# EAGLE design mem3-c (EAGLE 4.13)
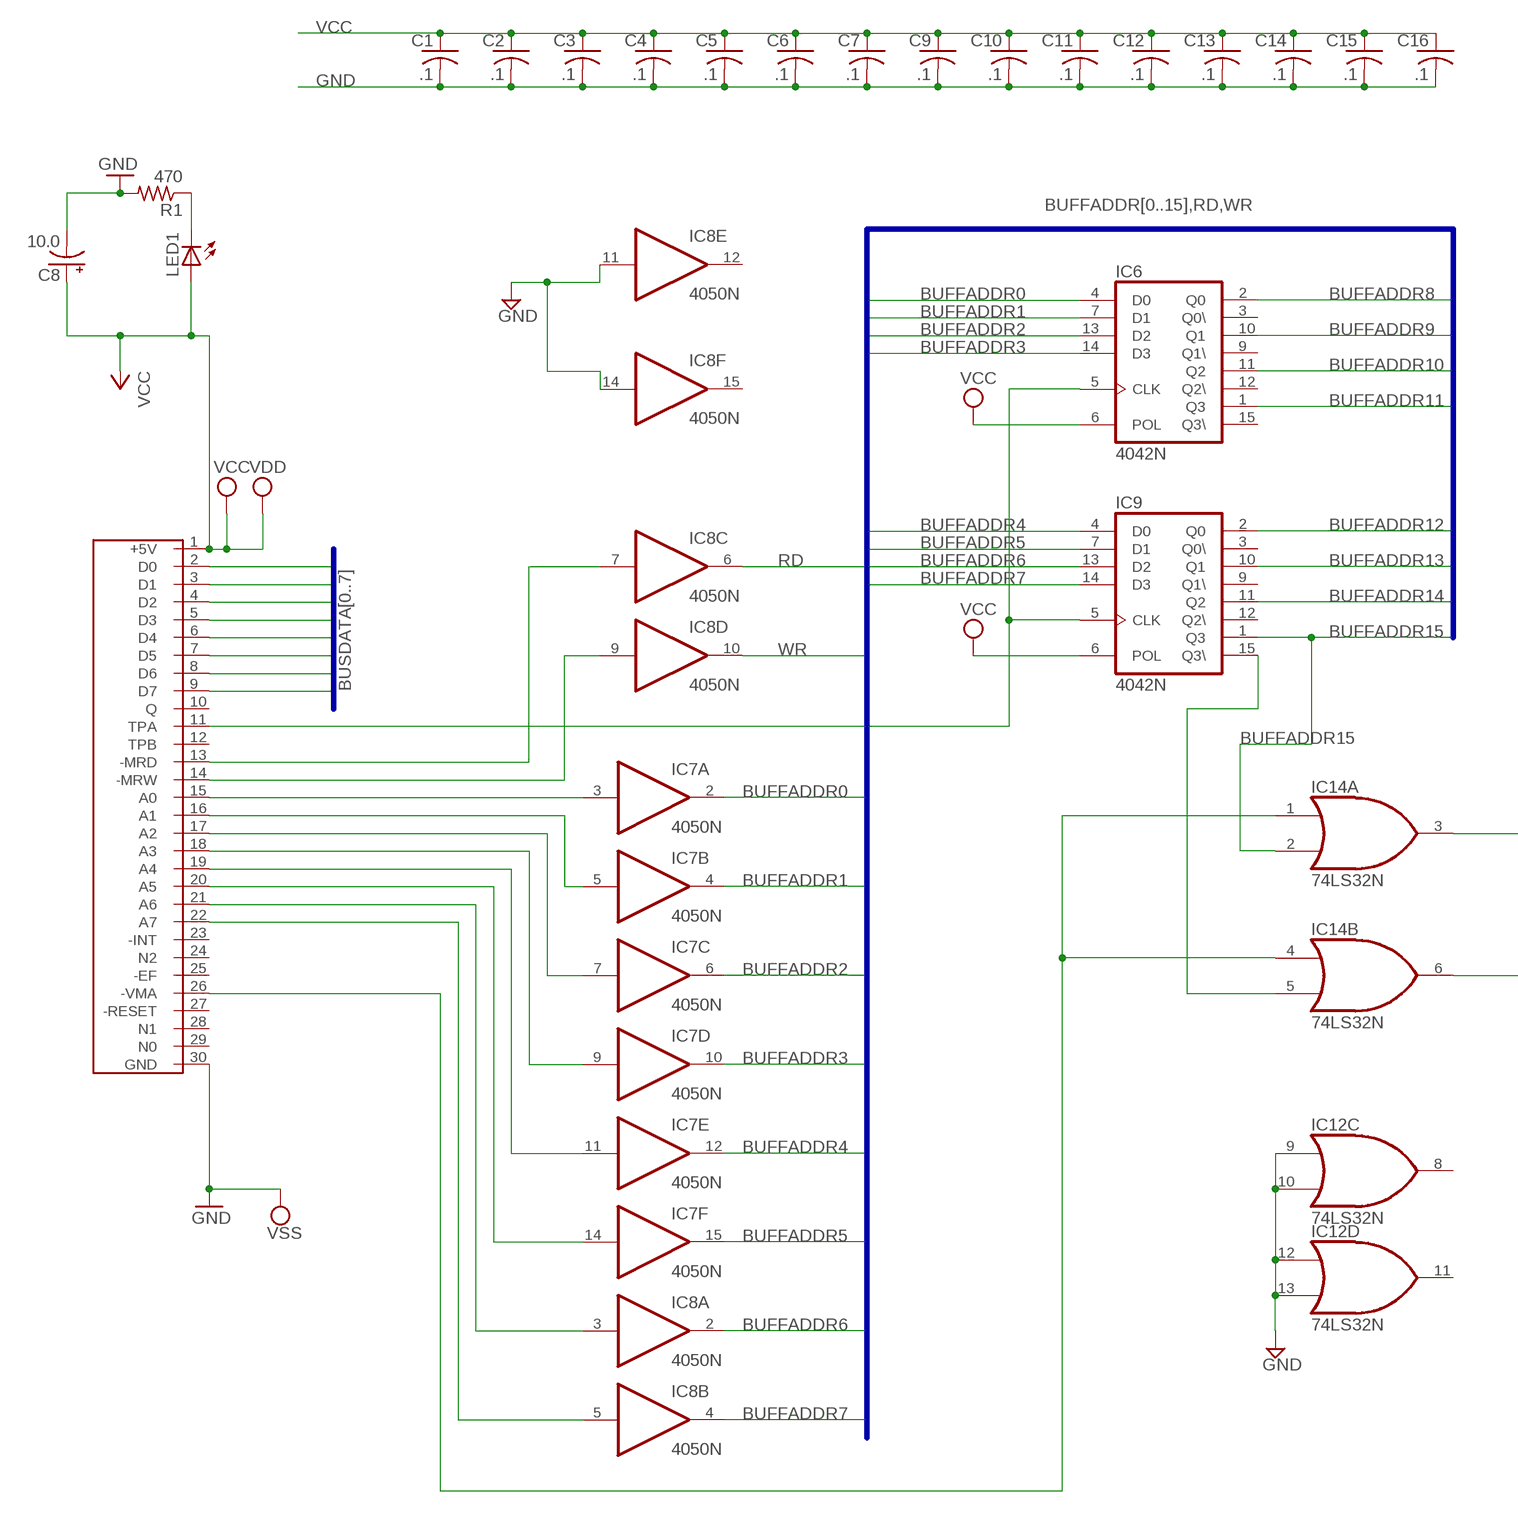
[diagram p0: schematic, sheet 1, part 1 of 2]
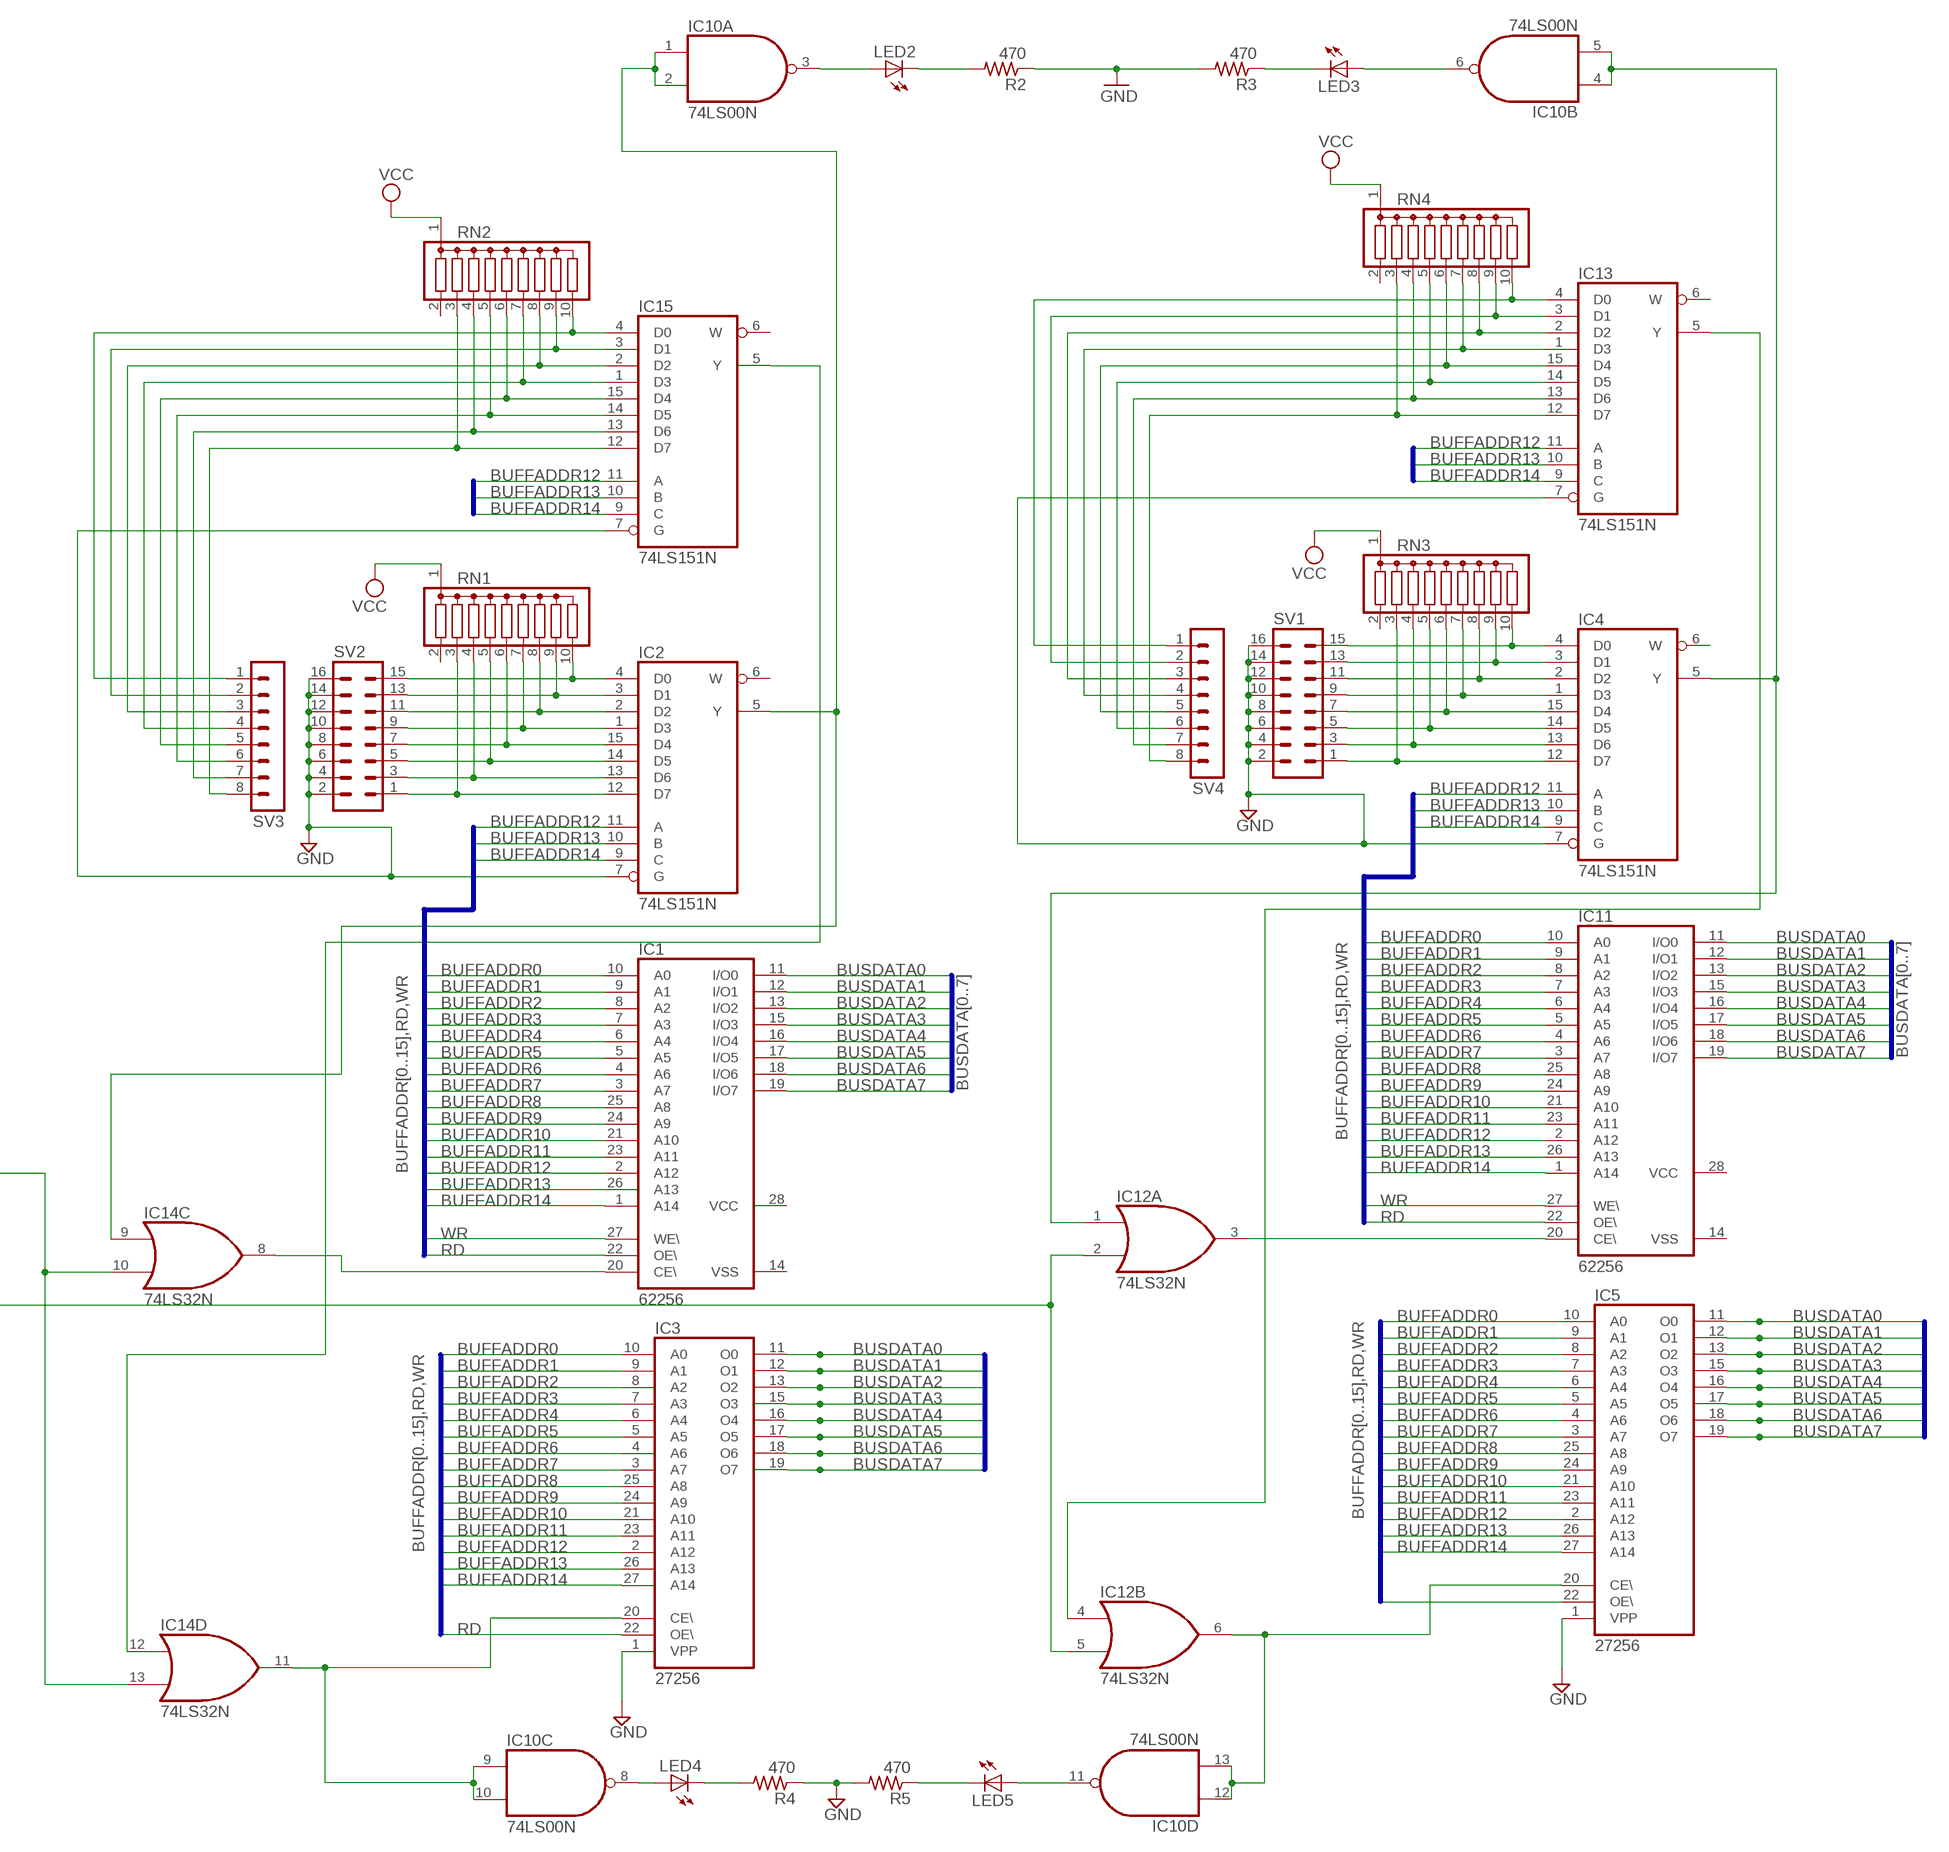
[diagram p1: schematic, sheet 1, part 2 of 2]

## Parts
C1  .1  C-US025-050X050  [C025-050X050]
C2  .1  C-US025-050X050  [C025-050X050]
C3  .1  C-US025-050X050  [C025-050X050]
C4  .1  C-US025-050X050  [C025-050X050]
C5  .1  C-US025-050X050  [C025-050X050]
C6  .1  C-US025-050X050  [C025-050X050]
C7  .1  C-US025-050X050  [C025-050X050]
C8  10.0  CPOL-USE2.5-7  [E2,5-7]
C9  .1  C-US025-050X050  [C025-050X050]
C10  .1  C-US025-050X050  [C025-050X050]
C11  .1  C-US025-050X050  [C025-050X050]
C12  .1  C-US025-050X050  [C025-050X050]
C13  .1  C-US025-050X050  [C025-050X050]
C14  .1  C-US025-050X050  [C025-050X050]
C15  .1  C-US025-050X050  [C025-050X050]
C16  .1  C-US025-050X050  [C025-050X050]
IC1  62256  58C256P  [DIL28-6]
IC2  74LS151N  [DIL16]
IC3  27256  [DIL28]
IC4  74LS151N  [DIL16]
IC5  27256  [DIL28]
IC6  4042N  [DIL16]
IC7  4050N  [DIL16]
IC8  4050N  [DIL16]
IC9  4042N  [DIL16]
IC10  74LS00N  [DIL14]
IC11  62256  58C256P  [DIL28-6]
IC12  74LS32N  [DIL14]
IC13  74LS151N  [DIL16]
IC14  74LS32N  [DIL14]
IC15  74LS151N  [DIL16]
LED1  LED5MM  [LED5MM]
LED2  LED5MM  [LED5MM]
LED3  LED5MM  [LED5MM]
LED4  LED5MM  [LED5MM]
LED5  LED5MM  [LED5MM]
R1  470  R-US_0207/7  [0207/7]
R2  470  R-US_0207/7  [0207/7]
R3  470  R-US_0207/7  [0207/7]
R4  470  R-US_0207/7  [0207/7]
R5  470  R-US_0207/7  [0207/7]
RN1  G09R  [SIL10]
RN2  G09R  [SIL10]
RN3  G09R  [SIL10]
RN4  G09R  [SIL10]
SV1  MA08-2  [MA08-2]
SV2  MA08-2  [MA08-2]
SV3  MA08-1  [MA08-1]
SV4  MA08-1  [MA08-1]
U$1  C30  [C30]

## Nets
BUFFADDR0: IC1.10(A0) IC3.10(A0) IC5.10(A0) IC6.4(D0) IC7.2(A:O) IC11.10(A0)
BUFFADDR1: IC1.9(A1) IC3.9(A1) IC5.9(A1) IC6.7(D1) IC7.4(B:O) IC11.9(A1)
BUFFADDR2: IC1.8(A2) IC3.8(A2) IC5.8(A2) IC6.13(D2) IC7.6(C:O) IC11.8(A2)
BUFFADDR3: IC1.7(A3) IC3.7(A3) IC5.7(A3) IC6.14(D3) IC7.10(D:O) IC11.7(A3)
BUFFADDR4: IC1.6(A4) IC3.6(A4) IC5.6(A4) IC7.12(E:O) IC9.4(D0) IC11.6(A4)
BUFFADDR5: IC1.5(A5) IC3.5(A5) IC5.5(A5) IC7.15(F:O) IC9.7(D1) IC11.5(A5)
BUFFADDR6: IC1.4(A6) IC3.4(A6) IC5.4(A6) IC8.2(A:O) IC9.13(D2) IC11.4(A6)
BUFFADDR7: IC1.3(A7) IC3.3(A7) IC5.3(A7) IC8.4(B:O) IC9.14(D3) IC11.3(A7)
BUFFADDR8: IC1.25(A8) IC3.25(A8) IC5.25(A8) IC6.2(Q0) IC11.25(A8)
BUFFADDR9: IC1.24(A9) IC3.24(A9) IC5.24(A9) IC6.10(Q1) IC11.24(A9)
BUFFADDR10: IC1.21(A10) IC3.21(A10) IC5.21(A10) IC6.11(Q2) IC11.21(A10)
BUFFADDR11: IC1.23(A11) IC3.23(A11) IC5.23(A11) IC6.1(Q3) IC11.23(A11)
BUFFADDR12: IC1.2(A12) IC2.11(A) IC3.2(A12) IC4.11(A) IC5.2(A12) IC9.2(Q0) IC11.2(A12) IC13.11(A) IC15.11(A)
BUFFADDR13: IC1.26(A13) IC2.10(B) IC3.26(A13) IC4.10(B) IC5.26(A13) IC9.10(Q1) IC11.26(A13) IC13.10(B) IC15.10(B)
BUFFADDR14: IC1.1(A14) IC2.9(C) IC3.27(A14) IC4.9(C) IC5.27(A14) IC9.11(Q2) IC11.1(A14) IC13.9(C) IC15.9(C)
BUFFADDR15: IC9.1(Q3) IC14.2(A:I1)
BUSDATA0: IC1.11(I/O0) IC3.11(O0) IC5.11(O0) IC11.11(I/O0) U$1.2(D0)
BUSDATA1: IC1.12(I/O1) IC3.12(O1) IC5.12(O1) IC11.12(I/O1) U$1.3(D1)
BUSDATA2: IC1.13(I/O2) IC3.13(O2) IC5.13(O2) IC11.13(I/O2) U$1.4(D2)
BUSDATA3: IC1.15(I/O3) IC3.15(O3) IC5.15(O3) IC11.15(I/O3) U$1.5(D3)
BUSDATA4: IC1.16(I/O4) IC3.16(O4) IC5.16(O4) IC11.16(I/O4) U$1.6(D4)
BUSDATA5: IC1.17(I/O5) IC3.17(O5) IC5.17(O5) IC11.17(I/O5) U$1.7(D5)
BUSDATA6: IC1.18(I/O6) IC3.18(O6) IC5.18(O6) IC11.18(I/O6) U$1.8(D6)
BUSDATA7: IC1.19(I/O7) IC3.19(O7) IC5.19(O7) IC11.19(I/O7) U$1.9(D7)
GND: C1.2 C2.2 C3.2 C4.2 C5.2 C6.2 C7.2 C8.- C9.2 C10.2 C11.2 C12.2 C13.2 C14.2 C15.2 C16.2 IC2.7(G) IC3.1(VPP) IC4.7(G) IC5.1(VPP) IC8.11(E:I) IC8.14(F:I) IC12.9(C:I0) IC12.10(C:I1) IC12.12(D:I0) IC12.13(D:I1) IC13.7(G) IC15.7(G) R1.2 R2.1 R3.2 R4.1 R5.2 SV1.2 SV1.4 SV1.6 SV1.8 SV1.10 SV1.12 SV1.14 SV1.16 SV2.2 SV2.4 SV2.6 SV2.8 SV2.10 SV2.12 SV2.14 SV2.16 U$1.30(GND) ; supply symbol labelled VSS
N$1: LED1.K(C) R1.1
N$2: IC2.12(D7) RN1.3 SV2.1
N$3: IC2.13(D6) RN1.4 SV2.3
N$4: IC2.14(D5) RN1.5 SV2.5
N$5: IC6.5(CLK) IC9.5(CLK) U$1.11(TPA)
N$6: IC2.15(D4) RN1.6 SV2.7
N$7: IC7.3(A:I) U$1.15(A0)
N$8: IC7.5(B:I) U$1.16(A1)
N$9: IC7.7(C:I) U$1.17(A2)
N$10: IC7.9(D:I) U$1.18(A3)
N$11: IC7.11(E:I) U$1.19(A4)
N$12: IC7.14(F:I) U$1.20(A5)
N$13: IC8.3(A:I) U$1.21(A6)
N$14: IC8.5(B:I) U$1.22(A7)
N$15: IC2.1(D3) RN1.7 SV2.9
N$16: IC2.2(D2) RN1.8 SV2.11
N$17: IC2.3(D1) RN1.9 SV2.13
N$18: IC2.4(D0) RN1.10 SV2.15
N$19: IC10.8(C:O) LED4.A
N$20: IC12.2(A:I1) IC12.5(B:I1) IC14.6(B:O)
N$21: IC4.12(D7) RN3.3 SV1.1
N$22: IC4.13(D6) RN3.4 SV1.3
N$23: IC4.14(D5) RN3.5 SV1.5
N$24: IC4.15(D4) RN3.6 SV1.7
N$25: IC8.9(D:I) U$1.14(-MRW)
N$26: IC8.7(C:I) U$1.13(-MRD)
N$27: IC14.1(A:I0) IC14.4(B:I0) U$1.26(-VMA)
N$28: IC4.1(D3) RN3.7 SV1.9
N$29: IC4.2(D2) RN3.8 SV1.11
N$30: IC4.3(D1) RN3.9 SV1.13
N$31: IC14.3(A:O) IC14.10(C:I1) IC14.13(D:I1)
N$32: LED4.K(C) R4.2
N$33: IC4.4(D0) RN3.10 SV1.15
N$34: IC2.5(Y) IC10.1(A:I0) IC10.2(A:I1) IC14.9(C:I0)
N$35: IC1.20(CE\) IC14.8(C:O)
N$36: IC14.12(D:I0) IC15.5(Y)
N$37: IC5.20(CE\) IC10.12(D:I0) IC10.13(D:I1) IC12.6(B:O)
N$38: IC13.13(D6) RN4.4 SV4.7
N$39: IC13.14(D5) RN4.5 SV4.6
N$40: IC13.15(D4) RN4.6 SV4.5
N$41: IC13.1(D3) RN4.7 SV4.4
N$42: IC13.2(D2) RN4.8 SV4.3
N$43: IC13.3(D1) RN4.9 SV4.2
N$44: IC3.20(CE\) IC10.9(C:I0) IC10.10(C:I1) IC14.11(D:O)
N$45: IC13.12(D7) RN4.3 SV4.8
N$46: IC13.4(D0) RN4.10 SV4.1
N$47: IC11.20(CE\) IC12.3(A:O)
N$49: IC12.4(B:I0) IC13.5(Y)
N$50: IC9.15(Q3\) IC14.5(B:I1)
N$51: IC4.5(Y) IC10.4(B:I0) IC10.5(B:I1) IC12.1(A:I0)
N$55: IC15.12(D7) RN2.3 SV3.8
N$56: LED5.K(C) R5.1
N$57: IC10.11(D:O) LED5.A
N$58: IC10.3(A:O) LED2.A
N$59: LED2.K(C) R2.2
N$60: IC15.13(D6) RN2.4 SV3.7
N$61: LED3.K(C) R3.1
N$62: IC10.6(B:O) LED3.A
N$63: IC15.14(D5) RN2.5 SV3.6
N$64: IC15.15(D4) RN2.6 SV3.5
N$65: IC15.1(D3) RN2.7 SV3.4
N$66: IC15.2(D2) RN2.8 SV3.3
N$67: IC15.3(D1) RN2.9 SV3.2
N$68: IC15.4(D0) RN2.10 SV3.1
RD: IC1.22(OE\) IC3.22(OE\) IC5.22(OE\) IC8.6(C:O) IC11.22(OE\)
VCC: C1.1 C2.1 C3.1 C4.1 C5.1 C6.1 C7.1 C8.+ C9.1 C10.1 C11.1 C12.1 C13.1 C14.1 C15.1 C16.1 IC6.6(POL) IC9.6(POL) LED1.A RN1.1 RN2.1 RN3.1 RN4.1 U$1.1(+5V) ; supply symbol labelled VDD
WR: IC1.27(WE\) IC8.10(D:O) IC11.27(WE\)
Unconnected: IC2.6(W) IC4.6(W) IC6.3(Q0\) IC6.9(Q1\) IC6.12(Q2\) IC6.15(Q3\) IC8.12(E:O) IC8.15(F:O) IC9.3(Q0\) IC9.9(Q1\) IC9.12(Q2\) IC12.8(C:O) IC12.11(D:O) IC13.6(W) IC15.6(W) RN1.2 RN2.2 RN3.2 RN4.2 U$1.10(Q) U$1.12(TPB) U$1.23(-INT) U$1.24(N2) U$1.25(-EF) U$1.27(-RESET) U$1.28(N1) U$1.29(N0)

## Buses
BUFFADDR[0..15],RD,WR
BUSDATA[0..7]

## Power pins joined to a net without a drawn wire
GND: IC1.14(VSS) IC2.8(GND) IC3.14(GND) IC4.8(GND) IC5.14(GND) IC6.8(VSS) IC7.8(P:VSS) IC8.8(P:VSS) IC9.8(VSS) IC10.7(P:GND) IC11.14(VSS) IC12.7(P:GND) IC13.8(GND) IC14.7(P:GND) IC15.8(GND)
VCC: IC1.28(VCC) IC2.16(VCC) IC3.28(VCC) IC4.16(VCC) IC5.28(VCC) IC6.16(VDD) IC7.1(P:VDD) IC8.1(P:VDD) IC9.16(VDD) IC10.14(P:VCC) IC11.28(VCC) IC12.14(P:VCC) IC13.16(VCC) IC14.14(P:VCC) IC15.16(VCC)

## Library data of the parts
C1-C7 C9-C16 = rcl:C-US: CAPACITOR, American symbol
C8 = rcl:CPOL-US: POLARIZED CAPACITOR, American symbol
IC1 IC11 = memory-hitachi:58C256P: MEMORY
IC2 IC4 IC13 IC15 = 74xx-us:74*151: Data SELECTOR/MULTIPLEXER
IC3 IC5 = memory:27256: MEMORY
IC6 IC9 = 40xx:4042: Quad clocked D LATCH
IC7 IC8 = 40xx:4050: Hex non-inverting BUFFER
IC10 = 74xx-us:74*00: Quad 2-input NAND gate
IC12 IC14 = 74xx-us:74*32: Quad 2-input OR gate
LED1-LED5 = led:LED: LED OSRAM: - CHIPLED LG R971, LG N971, LY N971, LG Q971, LY Q971, LO R971, LY R971 LH N974, LH R974 LS Q976, LO Q976, LY Q976 LO Q996 - Hyper CHIPLED LW Q18S LB Q993, LB Q99A, LB R99A - SideLED LS A670, LO A670, LY A670, LG A670, LP A670 LB A673, LV A673, LT A673, LW A673 LH A674 LY A675 LS A676, LA A676, LO A676, LY A676, LW A676 LS A679, LY A679, LG A679 - Hyper Micro SIDELED® LS Y876, LA Y876, LO Y876, LY Y876 LT Y87S - SmartLED LW L88C, LW L88S LB L89C, LB L89S, LG L890 LS L89K, LO L89K, LY L89K LS L896, LA L896, LO L896, LY L896 - TOPLED LS T670, LO T670, LY T670, LG T670, LP T670 LSG T670, LSP T670, LSY T670, LOP T670, LYG T670 LG T671, LOG T671, LSG T671 LB T673, LV T673, LT T673, LW T673 LH T674 LS T676, LA T676, LO T676, LY T676, LB T676, LH T676, LSB T676, LW T676 LB T67C, LV T67C, LT T67C, LS T67K, LO T67K, LY T67K, LW E67C LS E67B, LA E67B, LO E67B, LY E67B, LB E67C, LV E67C, LT E67C LW T67C LS T679, LY T679, LG T679 LS T770, LO T770, LY T770, LG T770, LP T770 LB T773, LV T773, LT T773, LW T773 LH T774 LS E675, LA E675, LY E675, LS T675 LS T776, LA T776, LO T776, LY T776, LB T776 LHGB T686 LT T68C, LB T68C - Hyper Mini TOPLED® LB M676 - Mini TOPLED Santana® LG M470 LS M47K, LO M47K, LY M47K Source: http://www.osram.convergy.de/
R1-R5 = rcl:R-US_: RESISTOR, American symbol
RN1-RN4 = resistor-sil:G09R: SIL RESISTOR
SV1 SV2 = con-lstb:MA08-2: PIN HEADER
SV3 SV4 = con-lstb:MA08-1: PIN HEADER
U$1 = k1:C30

## Board
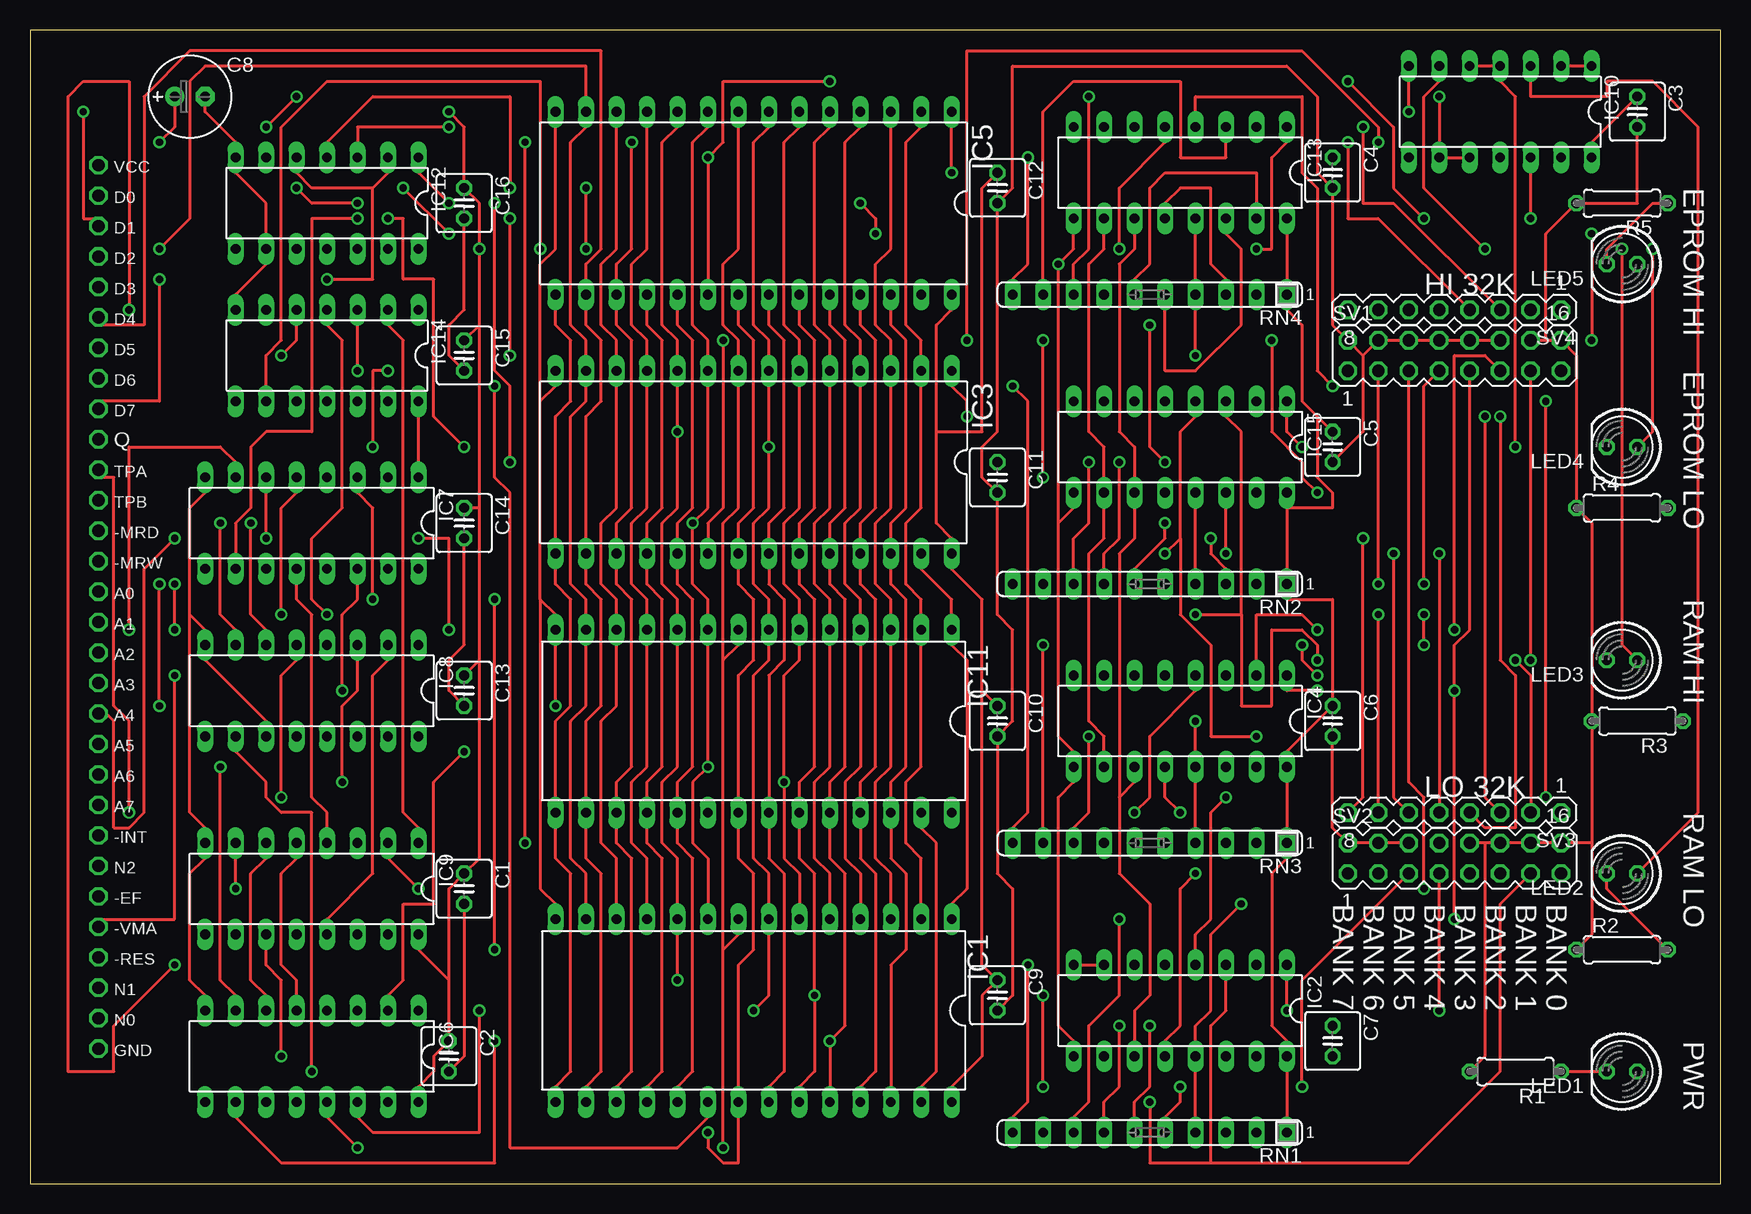
[diagram p2: board, top side]
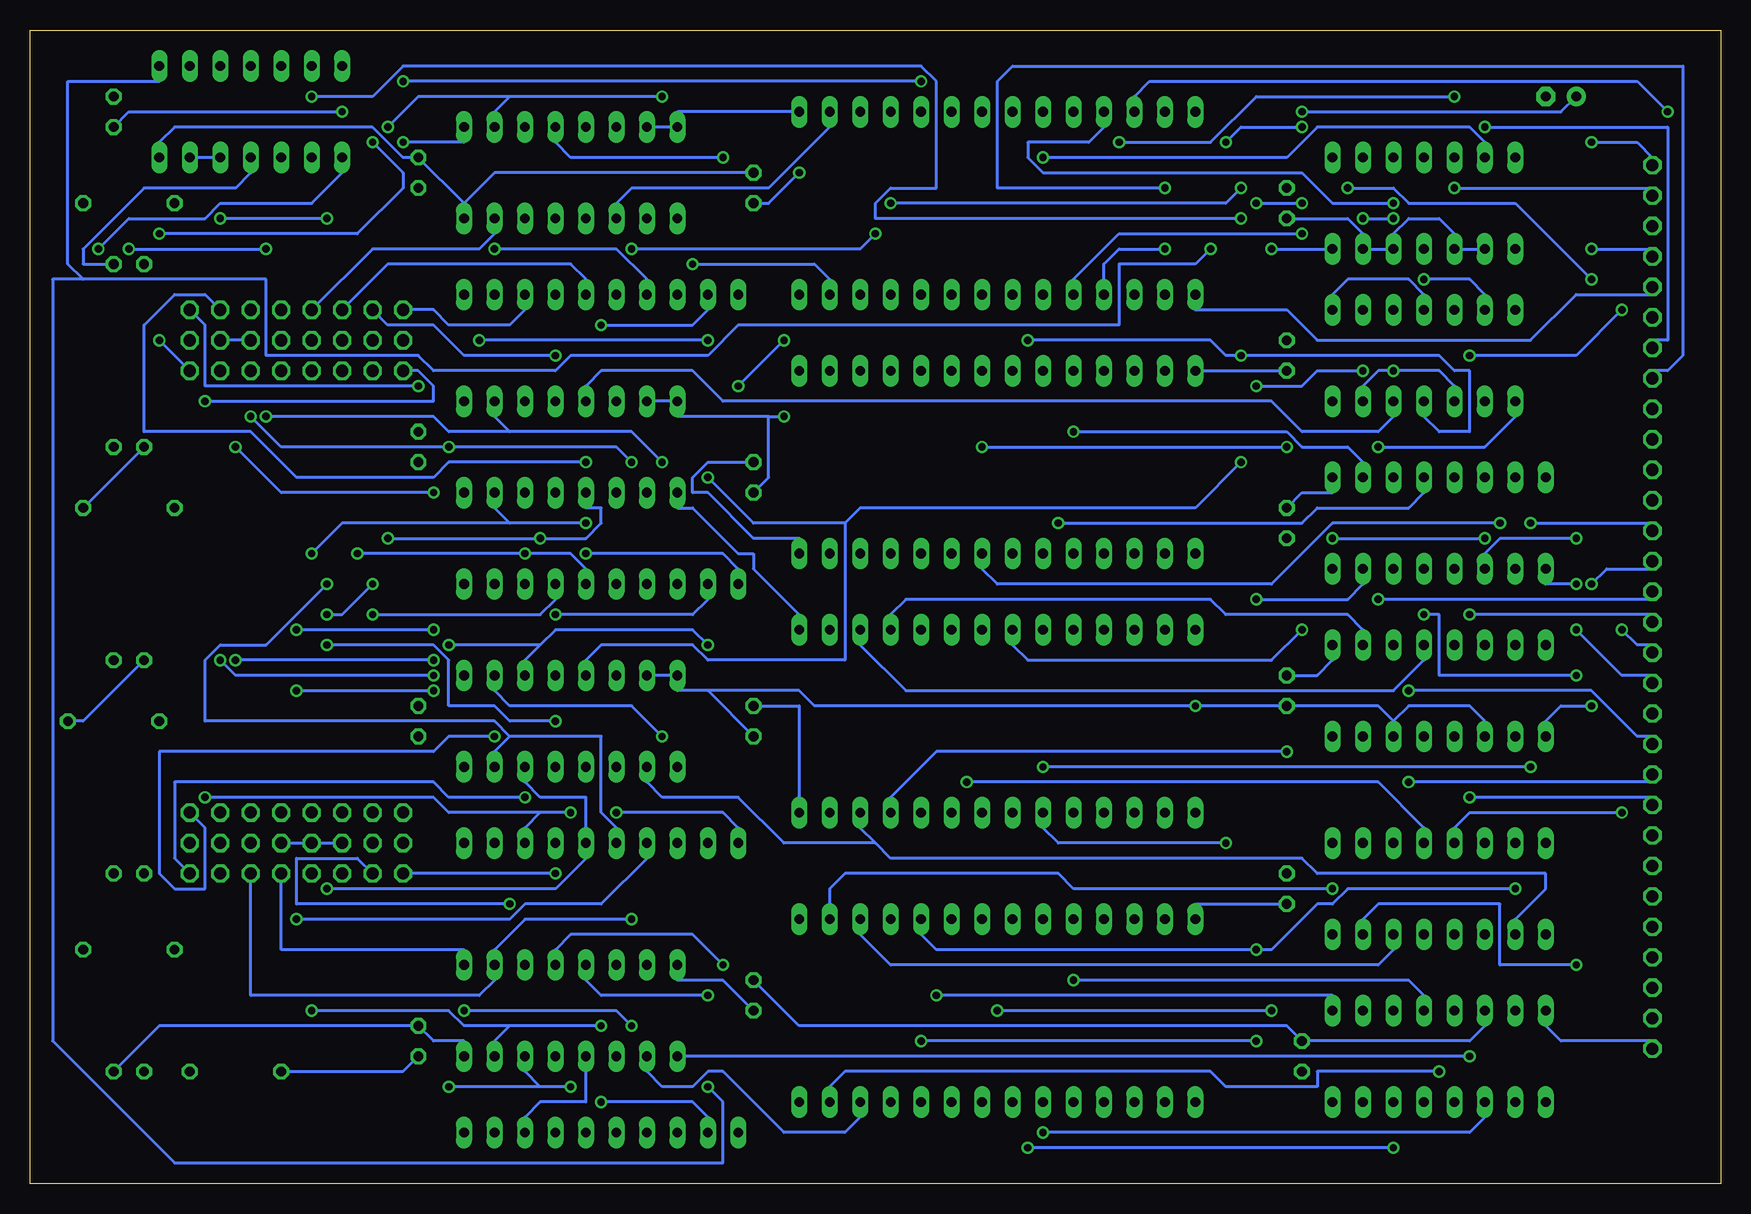
[diagram p3: board, bottom side, seen from below]

Size 140.95 x 96.19 mm. Coordinates in mm from the lower left corner, seen from the top.
Outline: 0,0 140.95,0 140.95,96.19 0,96.19 0,0
Copper layers (1*16): Top 0.035mm / dielectric 1.5mm / Bottom 0.035mm
Design rules "default": minimum track width 10mil, minimum drill 24mil, track to track 8mil, track to pad 8mil, pad to pad 8mil, via to via 8mil, smd to smd 8mil, copper to edge 40mil, drill to drill 8mil, minimum pad ring 10mil, minimum via ring 8mil, stop-mask expansion 4mil, vias tented up to drill 0mil, thermal gap 10mil

### Footprints (pad centres in the part's own frame; a part is rotated, then mirrored left to right if it is on the bottom)
C025-050X050 = drill 0.813 octagon: 1 -1.27,0; 2 1.27,0
E2,5-7 = drill 0.813 pad 1.6 round: + -1.27,0 | drill 0.813 pad 1.6 octagon: - 1.27,0
DIL28-6 = drill 0.813 long: 1 -16.51,-7.62; 2 -13.97,-7.62; 3 -11.43,-7.62; 4 -8.89,-7.62; 5 -6.35,-7.62; 6 -3.81,-7.62; 7 -1.27,-7.62; 8 1.27,-7.62; 9 3.81,-7.62; 10 6.35,-7.62; 11 8.89,-7.62; 12 11.43,-7.62; 13 13.97,-7.62; 14 16.51,-7.62; 15 16.51,7.62; 16 13.97,7.62; 17 11.43,7.62; 18 8.89,7.62; 19 6.35,7.62; 20 3.81,7.62; 21 1.27,7.62; 22 -1.27,7.62; 23 -3.81,7.62; 24 -6.35,7.62; 25 -8.89,7.62; 26 -11.43,7.62; 27 -13.97,7.62; 28 -16.51,7.62
DIL16 = drill 0.813 long: 1 -8.89,-3.81; 2 -6.35,-3.81; 3 -3.81,-3.81; 4 -1.27,-3.81; 5 1.27,-3.81; 6 3.81,-3.81; 7 6.35,-3.81; 8 8.89,-3.81; 9 8.89,3.81; 10 6.35,3.81; 11 3.81,3.81; 12 1.27,3.81; 13 -1.27,3.81; 14 -3.81,3.81; 15 -6.35,3.81; 16 -8.89,3.81
DIL28 = drill 0.813 long: 1 -16.51,-7.62; 2 -13.97,-7.62; 3 -11.43,-7.62; 4 -8.89,-7.62; 5 -6.35,-7.62; 6 -3.81,-7.62; 7 -1.27,-7.62; 8 1.27,-7.62; 9 3.81,-7.62; 10 6.35,-7.62; 11 8.89,-7.62; 12 11.43,-7.62; 13 13.97,-7.62; 14 16.51,-7.62; 15 16.51,7.62; 16 13.97,7.62; 17 11.43,7.62; 18 8.89,7.62; 19 6.35,7.62; 20 3.81,7.62; 21 1.27,7.62; 22 -1.27,7.62; 23 -3.81,7.62; 24 -6.35,7.62; 25 -8.89,7.62; 26 -11.43,7.62; 27 -13.97,7.62; 28 -16.51,7.62
DIL14 = drill 0.813 long: 1 -7.62,-3.81; 2 -5.08,-3.81; 3 -2.54,-3.81; 4 0,-3.81; 5 2.54,-3.81; 6 5.08,-3.81; 7 7.62,-3.81; 8 7.62,3.81; 9 5.08,3.81; 10 2.54,3.81; 11 0,3.81; 12 -2.54,3.81; 13 -5.08,3.81; 14 -7.62,3.81
LED5MM = drill 0.813 octagon: A -1.27,0; K 1.27,0
0207/7 = drill 0.813 octagon: 1 -3.81,0; 2 3.81,0
SIL10 = drill 0.813 long: 1 -11.43,0; 2 -8.89,0; 3 -6.35,0; 4 -3.81,0; 5 -1.27,0; 6 1.27,0; 7 3.81,0; 8 6.35,0; 9 8.89,0; 10 11.43,0
MA08-2 = drill 1.016 octagon: 1 -8.89,-1.27; 2 -8.89,1.27; 3 -6.35,-1.27; 4 -6.35,1.27; 5 -3.81,-1.27; 6 -3.81,1.27; 7 -1.27,-1.27; 8 -1.27,1.27; 9 1.27,-1.27; 10 1.27,1.27; 11 3.81,-1.27; 12 3.81,1.27; 13 6.35,-1.27; 14 6.35,1.27; 15 8.89,-1.27; 16 8.89,1.27
MA08-1 = drill 1.016 octagon: 1 -8.89,0; 2 -6.35,0; 3 -3.81,0; 4 -1.27,0; 5 1.27,0; 6 3.81,0; 7 6.35,0; 8 8.89,0
C30 = drill 1.016 octagon: 1 -36.83,0; 2 -34.29,0; 3 -31.75,0; 4 -29.21,0; 5 -26.67,0; 6 -24.13,0; 7 -21.59,0; 8 -19.05,0; 9 -16.51,0; 10 -13.97,0; 11 -11.43,0; 12 -8.89,0; 13 -6.35,0; 14 -3.81,0; 15 -1.27,0; 16 1.27,0; 17 3.81,0; 18 6.35,0; 19 8.89,0; 20 11.43,0; 21 13.97,0; 22 16.51,0; 23 19.05,0; 24 21.59,0; 25 24.13,0; 26 26.67,0; 27 29.21,0; 28 31.75,0; 29 34.29,0; 30 36.83,0

### Placement (x,y rotation side)
C1  36.19,24.6 270 top
C2  34.92,10.63 270 top
C3  133.98,89.37 270 top
C4  108.58,84.29 270 top
C5  108.58,61.43 270 top
C6  108.58,38.57 270 top
C7  108.58,11.9 270 top
C8  13.33,90.64 0 top
C9  80.64,15.71 270 top
C10  80.64,38.57 270 top
C11  80.64,58.89 270 top
C12  80.64,83.02 270 top
C13  36.19,41.11 270 top
C14  36.19,55.08 270 top
C15  36.19,69.05 270 top
C16  36.19,81.75 270 top
IC1  60.32,14.44 180 top
IC2  95.88,14.44 180 top
IC3  60.32,60.16 180 top
IC4  95.88,38.57 180 top
IC5  60.32,81.75 180 top
IC6  23.49,10.63 180 top
IC7  23.49,55.08 180 top
IC8  23.49,41.11 180 top
IC9  23.49,24.6 180 top
IC10  122.55,89.37 180 top
IC11  60.32,38.57 180 top
IC12  24.76,81.75 180 top
IC13  95.88,84.29 180 top
IC14  24.76,69.05 180 top
IC15  95.88,61.43 180 top
LED1  132.71,9.36 180 top
LED2  132.71,25.87 180 top
LED3  132.71,43.65 180 top
LED4  132.71,61.43 180 top
LED5  132.71,76.67 180 top
R1  123.82,9.36 180 top
R2  132.71,19.52 0 top
R3  133.98,38.57 180 top
R4  132.71,56.35 0 top
R5  132.71,81.75 180 top
RN1  93.34,4.28 180 top
RN2  93.34,50 180 top
RN3  93.34,28.41 180 top
RN4  93.34,74.13 180 top
SV1  118.74,69.05 0 top
SV2  118.74,27.14 0 top
SV3  118.74,30.95 180 top
SV4  118.74,72.86 180 top
U$1  5.71,48.09 270 top

### Tracks (layer width: path | path; a pad name or v marks a point on that pad's centre or on a via)
BUFFADDR0  (via drill 0.61)
  Top 0.254: v53.97,16.98 IC1.10 53.97,27.14 52.7,28.41 52.7,33.49 53.97,34.76 IC11.10 53.97,48.73 52.7,50 52.7,55.08 53.97,56.35 v53.97,62.7 IC3.10 53.97,70.32 52.7,71.59 52.7,86.83 53.97,88.1 IC5.10
  Bottom 0.254: v53.97,16.98 26.03,16.98 24.76,15.71 IC6.4 | v53.97,62.7 36.19,62.7 34.92,61.43 31.11,61.43 29.84,60.16 IC7.2
BUFFADDR1  (via drill 0.61)
  Top 0.254: IC5.9 56.51,88.1 55.24,86.83 55.24,71.59 56.51,70.32 IC3.9 56.51,56.35 v55.24,55.08 55.24,50 56.51,48.73 IC11.9 v56.51,34.76 55.24,33.49 55.24,28.41 56.51,27.14 IC1.9 | v15.87,34.76 15.87,16.98 17.14,15.71 IC6.7
  Bottom 0.254: v55.24,55.08 34.92,55.08 33.65,56.35 26.03,56.35 24.76,57.62 IC7.4 | v15.87,34.76 v56.51,34.76
BUFFADDR2  (via drill 0.61)
  Top 0.254: v27.3,3.01 24.76,5.55 IC6.13 | v57.78,3.01 57.78,19.52 | 57.78,19.52 59.05,20.79 IC1.8 | 57.78,43.65 59.05,44.92 IC11.8 | 57.78,19.52 57.78,43.65 | v32.38,53.81 34.92,53.81 v34.92,46.19 | v19.68,53.81 IC7.6 | 57.78,43.65 57.78,55.08 59.05,56.35 IC3.8 59.05,70.32 57.78,71.59 57.78,76.67 59.05,77.94 IC5.8
  Bottom 0.254: v27.3,3.01 v57.78,3.01 | v32.38,53.81 v19.68,53.81 | v34.92,46.19 37.46,43.65 57.78,43.65 59.05,44.92 IC11.8
BUFFADDR3  (via drill 0.61)
  Top 0.254: v37.46,14.44 37.46,4.28 28.57,4.28 27.3,5.55 IC6.14 | v60.32,14.44 61.59,15.71 IC1.7 61.59,25.87 60.32,27.14 60.32,42.38 61.59,43.65 IC11.7 61.59,48.73 60.32,50 60.32,55.08 61.59,56.35 v61.59,61.43 IC3.7 61.59,70.32 60.32,71.59 60.32,86.83 61.59,88.1 IC5.7 | v27.3,80.48 23.49,80.48 23.49,62.7 19.68,62.7 18.41,61.43 18.41,56.35 17.14,55.08 IC7.10 | v29.84,80.48 31.11,80.48 31.11,75.4 33.65,75.4 33.65,63.97 v36.19,61.43
  Bottom 0.254: v37.46,14.44 v60.32,14.44 | v29.84,80.48 v27.3,80.48 | v61.59,61.43 v36.19,61.43
BUFFADDR4  (via drill 0.61)
  Top 0.254: IC7.12 22.22,48.73 23.49,47.46 23.49,32.22 24.76,30.95 IC9.4 | IC5.6 64.13,88.1 62.86,86.83 62.86,71.59 64.13,70.32 IC3.6 64.13,56.35 62.86,55.08 62.86,50 64.13,48.73 IC11.6 64.13,43.65 62.86,42.38 v62.86,33.49 62.86,27.14 64.13,25.87 IC1.6
  Bottom 0.254: v62.86,33.49 28.57,33.49 24.76,29.68 IC9.4
BUFFADDR5  (via drill 0.61)
  Top 0.254: IC5.5 66.67,88.1 65.4,86.83 65.4,71.59 66.67,70.32 IC3.5 66.67,56.35 65.4,55.08 65.4,50 66.67,48.73 IC11.5 66.67,34.76 65.4,33.49 65.4,27.14 66.67,25.87 IC1.5 | v17.14,24.6 IC9.7 | v38.73,19.52 v38.73,48.73
  Bottom 0.254: v17.14,24.6 31.11,24.6 32.38,23.33 33.65,23.33 37.46,19.52 v38.73,19.52 65.4,19.52 66.67,20.79 IC1.5 | v38.73,48.73 31.11,48.73 29.84,50 IC7.15
BUFFADDR6
  Top 0.254: IC9.13 24.76,22.06 28.57,25.87 28.57,42.38 29.84,43.65 IC8.2 | IC5.4 69.21,88.1 67.94,86.83 67.94,71.59 69.21,70.32 IC3.4 69.21,56.35 67.94,55.08 67.94,50 69.21,48.73 IC11.4 69.21,34.76 67.94,33.49 67.94,27.14 69.21,25.87 IC1.4
  Bottom 0.254: IC8.2 29.84,46.19 31.11,47.46 41.27,47.46 42.54,48.73 67.94,48.73 69.21,47.46 IC11.4
BUFFADDR7
  Top 0.254: IC5.3 71.75,77.94 70.48,76.67 70.48,71.59 71.75,70.32 IC3.3 71.75,56.35 70.48,55.08 70.48,50 71.75,48.73 IC11.3 71.75,34.76 70.48,33.49 70.48,27.14 71.75,25.87 IC1.3
  Bottom 0.254: IC9.14 27.3,19.52 28.57,18.25 69.21,18.25 71.75,20.79 IC1.3 | IC8.4 24.76,43.65 27.3,41.11 67.94,41.11 71.75,44.92 IC11.3
BUFFADDR8  (via drill 0.61)
  Top 0.254: IC5.25 69.21,71.59 70.48,70.32 70.48,56.35 69.21,55.08 IC3.25 69.21,50 70.48,48.73 70.48,34.76 69.21,33.49 IC11.25 69.21,27.14 70.48,25.87 70.48,9.36 69.21,8.09 IC1.25 | v36.19,36.03 33.65,33.49 33.65,23.33 31.11,23.33 31.11,16.98 29.84,15.71 IC6.2
  Bottom 0.254: v36.19,36.03 65.4,36.03 69.21,32.22 IC11.25
BUFFADDR9  (via drill 0.61)
  Top 0.254: IC5.24 66.67,71.59 67.94,70.32 67.94,56.35 66.67,55.08 IC3.24 66.67,50 67.94,48.73 67.94,34.76 66.67,33.49 IC11.24 66.67,27.14 67.94,25.87 67.94,13.17 v66.67,11.9 IC1.24 | v38.73,11.9 38.73,1.74 20.95,1.74 17.14,5.55 IC6.10
  Bottom 0.254: v38.73,11.9 v66.67,11.9
BUFFADDR10  (via drill 0.61)
  Top 0.254: v56.51,4.28 56.51,3.01 57.78,1.74 59.05,1.74 IC1.21 59.05,18.25 60.32,19.52 60.32,25.87 59.05,27.14 IC11.21 59.05,42.38 60.32,43.65 60.32,48.73 59.05,50 IC3.21 59.05,55.08 60.32,56.35 60.32,70.32 59.05,71.59 IC5.21
  Bottom 0.254: v56.51,4.28 20.95,4.28 19.68,5.55 IC6.11
BUFFADDR11  (via drill 0.61)
  Top 0.254: IC5.23 64.13,71.59 65.4,70.32 65.4,56.35 64.13,55.08 IC3.23 64.13,50 65.4,48.73 65.4,34.76 64.13,33.49 IC11.23 64.13,27.14 65.4,25.87 v65.4,15.71 65.4,9.36 64.13,8.09 IC1.23
  Bottom 0.254: v65.4,15.71 32.38,15.71 IC6.1
BUFFADDR12  (via drill 0.61)
  Top 0.254: v32.38,24.6 29.84,27.14 IC9.2 | 90.8,32.22 90.8,25.87 93.34,23.33 93.34,15.71 92.07,14.44 IC2.11 | 90.8,32.22 92.07,33.49 IC4.11 | 90.8,32.22 90.8,52.54 92.07,53.81 IC15.11 92.07,61.43 90.8,62.7 90.8,76.67 92.07,77.94 IC13.11 | IC5.2 74.29,88.1 73.02,86.83 73.02,71.59 74.29,70.32 IC3.2 74.29,56.35 73.02,55.08 73.02,50 74.29,48.73 IC11.2 74.29,34.76 73.02,33.49 73.02,28.41 74.29,27.14 IC1.2
  Bottom 0.254: v32.38,24.6 53.97,24.6 55.24,25.87 73.02,25.87 74.29,24.6 IC1.2 | IC13.11 92.07,81.75 90.8,83.02 79.37,83.02 74.29,88.1 IC5.2
BUFFADDR13
  Top 0.254: IC13.10 89.53,77.94 88.26,76.67 88.26,62.7 89.53,61.43 IC15.10 89.53,53.81 88.26,52.54 88.26,38.57 89.53,37.3 IC4.10 | IC5.26 71.75,71.59 73.02,70.32 73.02,56.35 71.75,55.08 IC3.26 71.75,50 73.02,48.73 73.02,34.76 71.75,33.49 IC11.26 71.75,27.14 73.02,25.87 73.02,19.52 71.75,18.25 IC1.26
  Bottom 0.254: 70.48,28.41 71.75,29.68 IC11.26 | 70.48,28.41 69.21,27.14 34.92,27.14 33.65,25.87 14.6,25.87 14.6,24.6 17.14,22.06 IC9.10 | IC2.10 89.53,9.36 88.26,8.09 85.72,8.09 84.45,9.36 83.18,9.36 78.1,4.28 73.02,4.28 71.75,5.55 IC1.26 | 70.48,28.41 78.1,28.41 81.91,32.22 88.26,32.22 89.53,33.49 IC4.10
BUFFADDR14  (via drill 0.61)
  Top 0.254: IC1.1 76.83,23.33 78.1,24.6 78.1,43.65 76.83,44.92 IC11.1 76.83,48.73 74.29,51.27 IC3.27 | IC13.9 86.99,77.94 v85.72,76.67 85.72,55.08 | 85.72,55.08 85.72,37.3 86.99,36.03 IC4.9 86.99,33.49 85.72,32.22 85.72,13.17 86.99,11.9 IC2.9 | 85.72,55.08 86.99,56.35 IC15.9 | v20.95,10.63 20.95,16.98 19.68,18.25 IC9.11
  Bottom 0.254: v85.72,76.67 75.56,76.67 74.29,75.4 IC5.27 | IC11.1 76.83,47.46 80.64,51.27 80.64,52.54 81.91,52.54 85.72,56.35 86.99,56.35 IC15.9 | v20.95,10.63 IC2.9
BUFFADDR15
  Top 0.254: IC14.2 29.84,71.59 31.11,70.32 31.11,30.95 32.38,29.68 IC9.1
BUSDATA0  (via drill 0.61)
  Top 0.254: IC1.11 51.43,27.14 50.16,28.41 50.16,33.49 51.43,34.76 IC11.11 51.43,48.73 50.16,50 50.16,55.08 51.43,56.35 IC3.11 51.43,70.32 50.16,71.59 50.16,76.67 51.43,77.94 IC5.11 | v22.22,83.02 23.49,81.75 v27.3,81.75
  Bottom 0.254: v22.22,83.02 5.71,83.02 U$1.2 | v27.3,81.75 32.38,81.75 34.92,84.29 56.51,84.29 57.78,85.56 57.78,86.83 52.7,86.83 51.43,88.1 IC5.11
BUSDATA1  (via drill 0.61)
  Top 0.254: IC1.12 48.89,27.14 47.62,28.41 47.62,38.57 48.89,39.84 IC11.12 48.89,48.73 47.62,50 47.62,55.08 48.89,56.35 IC3.12 48.89,70.32 47.62,71.59 47.62,76.67 48.89,77.94 IC5.12 | v4.44,89.37 4.44,80.48 5.71,80.48 U$1.3
  Bottom 0.254: v4.44,89.37 6.98,91.91 47.62,91.91 48.89,90.64 IC5.12
BUSDATA2  (via drill 0.61)
  Top 0.254: IC1.13 46.35,25.87 45.08,27.14 45.08,38.57 46.35,39.84 IC11.13 46.35,48.73 45.08,50 45.08,63.97 46.35,65.24 IC3.13 46.35,70.32 45.08,71.59 45.08,86.83 46.35,88.1 IC5.13 46.35,93.18 14.6,93.18 13.33,91.91 13.33,80.48 v10.79,77.94
  Bottom 0.254: v10.79,77.94 5.71,77.94 U$1.4
BUSDATA3
  Top 0.254: IC1.15 43.81,8.09 45.08,9.36 45.08,25.87 43.81,27.14 IC11.15 43.81,38.57 45.08,39.84 45.08,48.73 43.81,50 IC3.15 43.81,63.97 45.08,65.24 45.08,70.32 43.81,71.59 IC5.15
  Bottom 0.254: U$1.5 5.71,74.13 12.06,74.13 15.87,70.32 33.65,70.32 36.19,72.86 43.81,72.86 IC5.15
BUSDATA4
  Top 0.254: IC1.16 46.35,8.09 47.62,9.36 47.62,25.87 46.35,27.14 IC11.16 46.35,38.57 47.62,39.84 47.62,48.73 46.35,50 IC3.16 46.35,63.97 47.62,65.24 47.62,70.32 46.35,71.59 IC5.16 46.35,76.67 47.62,77.94 47.62,94.45 13.33,94.45 9.52,90.64 9.52,71.59 5.71,71.59 U$1.6
BUSDATA5  (via drill 0.61)
  Top 0.254: IC1.17 48.89,8.09 50.16,9.36 50.16,27.14 48.89,28.41 IC11.17 48.89,33.49 50.16,34.76 50.16,48.73 48.89,50 IC3.17 48.89,55.08 50.16,56.35 50.16,70.32 48.89,71.59 IC5.17 48.89,76.67 50.16,77.94 v50.16,86.83 | v22.22,90.64 v19.68,88.1
  Bottom 0.254: v19.68,88.1 4.44,88.1 4.44,70.32 5.71,70.32 U$1.7 | v22.22,90.64 38.73,90.64 42.54,86.83 v50.16,86.83
BUSDATA6  (via drill 0.61)
  Top 0.254: IC1.18 51.43,8.09 52.7,9.36 52.7,27.14 51.43,28.41 IC11.18 51.43,33.49 52.7,34.76 52.7,48.73 51.43,50 IC3.18 51.43,55.08 52.7,56.35 52.7,70.32 51.43,71.59 IC5.18 | v46.35,77.94 v46.35,83.02
  Bottom 0.254: v46.35,83.02 60.32,83.02 60.32,91.91 59.05,93.18 3.17,93.18 3.17,69.05 4.44,67.78 5.71,67.78 U$1.8 | v46.35,77.94 50.16,77.94 51.43,76.67 IC5.18
BUSDATA7  (via drill 0.61)
  Top 0.254: IC1.19 53.97,8.09 55.24,9.36 55.24,27.14 53.97,28.41 IC11.19 53.97,33.49 55.24,34.76 55.24,48.73 53.97,50 IC3.19 53.97,55.08 55.24,56.35 55.24,70.32 53.97,71.59 IC5.19 | v10.79,75.4 10.79,65.24 5.71,65.24 U$1.9 | v34.92,79.21 v31.11,83.02
  Bottom 0.254: v10.79,75.4 17.14,81.75 26.03,81.75 27.3,83.02 v31.11,83.02 | v34.92,79.21 50.16,79.21 53.97,75.4 IC5.19
GND  (via drill 0.61)
  Top 0.254: C8.- 14.6,89.37 17.14,86.83 IC12.7 17.14,84.29 19.68,81.75 IC12.9 19.68,76.67 17.14,74.13 IC14.7 | C2.2 36.19,10.63 C1.2 | 42.54,48.73 43.81,47.46 IC11.14 v43.81,39.84 | 42.54,48.73 42.54,65.24 | 42.54,65.24 43.81,66.51 IC3.14 | 42.54,65.24 42.54,76.67 43.81,77.94 IC5.14 | 42.54,48.73 42.54,24.6 43.81,23.33 IC1.14 | C16.2 36.19,72.86 34.92,71.59 34.92,69.05 C15.2 | C3.2 133.98,81.75 R5.2 126.36,79.21 126.36,70.32 | v114.93,89.37 IC10.7 | 126.36,70.32 SV1.16 128.9,69.05 R4.1 130.17,55.08 R3.2 130.17,28.41 | SV1.14 126.36,70.32 | C5.2 111.12,62.7 111.12,69.05 | 111.12,69.05 SV1.2 108.58,71.59 C4.2 107.31,84.29 107.31,90.64 104.77,93.18 81.91,93.18 81.91,83.02 C12.2 80.64,62.7 79.37,61.43 79.37,58.89 C11.2 80.64,47.46 81.91,46.19 81.91,38.57 C10.2 80.64,25.87 81.91,24.6 81.91,15.71 C9.2 | 111.12,69.05 SV1.4 SV1.6 SV1.8 SV1.10 SV1.12 | C6.2 108.58,29.68 SV2.2 SV2.4 SV2.6 | 121.28,28.41 SV2.12 SV2.14 SV2.16 130.17,28.41 | 121.28,28.41 SV2.10 | R2.1 130.17,20.79 130.17,28.41 | R1.2 121.28,10.63 121.28,28.41 | IC6.8 14.6,15.71 13.33,16.98 13.33,25.87 14.6,27.14 IC9.8 14.6,29.68 13.33,30.95 13.33,47.46 | C14.2 36.19,44.92 34.92,43.65 34.92,41.11 C13.2 | IC8.11 19.68,38.57 14.6,43.65 IC8.8 14.6,46.19 13.33,47.46 | 13.33,47.46 13.33,56.35 14.6,57.62 IC7.8 | IC2.8 IC2.7 | v78.1,63.97 78.1,65.24 76.83,66.51 IC3.1 | v76.83,84.29 IC5.1
  Bottom 0.254: C16.2 31.11,80.48 29.84,79.21 IC12.13 IC12.12 27.3,79.21 26.03,80.48 23.49,80.48 22.22,79.21 IC12.10 IC12.9 | C1.2 43.81,23.33 IC1.14 | IC3.14 C15.2 | v114.93,89.37 132.71,89.37 C3.2 | SV1.12 SV1.14 | SV2.6 SV2.8 SV2.10 | C7.2 109.85,9.36 R1.2 | IC6.8 14.6,13.17 13.33,11.9 5.71,11.9 U$1.30 | 27.3,38.57 28.57,39.84 C13.2 v43.81,39.84 75.56,39.84 76.83,41.11 84.45,41.11 | 27.3,38.57 26.03,39.84 20.95,39.84 19.68,38.57 IC8.11 | 27.3,38.57 IC8.14 | C9.2 83.18,16.98 86.99,16.98 IC2.8 | 84.45,41.11 C10.2 | 84.45,41.11 86.99,41.11 IC4.8 IC4.7 | IC13.7 IC13.8 86.99,89.37 IC5.1 | C11.2 79.37,58.89 79.37,63.97 | 79.37,63.97 86.99,63.97 IC15.8 IC15.7 | 79.37,63.97 v78.1,63.97 | v76.83,84.29 79.37,81.75 C12.2
N$1
  Top 0.254: R1.1 LED1.K
N$2  (via drill 0.61)
  Top 0.254: v97.15,25.87 95.88,24.6 95.88,13.17 94.61,11.9 IC2.12
  Bottom 0.254: IC2.12 94.61,6.82 98.42,6.82 99.69,5.55 RN1.3 | v97.15,25.87 SV2.1
N$3  (via drill 0.61)
  Top 0.254: RN1.4 IC2.13 97.15,13.17 98.42,14.44 98.42,20.79 v100.96,23.33
  Bottom 0.254: SV2.3 113.66,27.14 118.74,27.14 118.74,23.33 v100.96,23.33
N$4  (via drill 0.61)
  Top 0.254: v95.88,8.09 95.88,6.82 94.61,5.55 RN1.5 | SV2.5 106.04,16.98 v106.04,8.09
  Bottom 0.254: v95.88,8.09 98.42,8.09 | 98.42,8.09 99.69,9.36 IC2.14 | 98.42,8.09 v106.04,8.09
N$5  (via drill 0.61)
  Top 0.254: IC6.5 22.22,16.98 20.95,18.25 20.95,25.87 22.22,27.14 IC9.5 | v8.25,30.95 8.25,38.57 6.98,39.84 6.98,58.89 5.71,58.89 U$1.11
  Bottom 0.254: v8.25,30.95 20.95,30.95 22.22,29.68 IC9.5
N$6  (via drill 0.61)
  Top 0.254: v93.34,13.17 93.34,8.09 92.07,6.82 RN1.6 | v117.47,14.44 SV2.7
  Bottom 0.254: v93.34,13.17 100.96,13.17 | 100.96,13.17 102.23,11.9 IC2.15 | v117.47,14.44 106.04,14.44 104.77,13.17 100.96,13.17
N$7  (via drill 0.61)
  Top 0.254: v28.57,48.73 28.57,56.35 27.3,57.62 IC7.3
  Bottom 0.254: v28.57,48.73 5.71,48.73 U$1.15
N$8  (via drill 0.61)
  Top 0.254: v20.95,47.46 20.95,56.35 22.22,57.62 IC7.5
  Bottom 0.254: v20.95,47.46 5.71,47.46 U$1.16
N$9  (via drill 0.61)
  Top 0.254: v8.25,46.19 8.25,61.43 15.87,61.43 17.14,60.16 IC7.7
  Bottom 0.254: v8.25,46.19 6.98,44.92 5.71,44.92 U$1.17
N$10  (via drill 0.61)
  Top 0.254: v12.06,46.19 v12.06,50
  Bottom 0.254: v12.06,50 14.6,50 IC7.9 | v12.06,46.19 8.25,42.38 5.71,42.38 U$1.18
N$11  (via drill 0.61)
  Top 0.254: v12.06,53.81 9.52,51.27 9.52,30.95 8.25,29.68 6.98,29.68 6.98,38.57 5.71,39.84 U$1.19
  Bottom 0.254: v12.06,53.81 18.41,53.81 19.68,52.54 IC7.11
N$12  (via drill 0.61)
  Top 0.254: v26.03,41.11 26.03,47.46 27.3,48.73 IC7.14
  Bottom 0.254: v26.03,41.11 10.79,41.11 6.98,37.3 5.71,37.3 U$1.20
N$13  (via drill 0.61)
  Top 0.254: v26.03,33.49 26.03,39.84 27.3,41.11 IC8.3
  Bottom 0.254: v26.03,33.49 5.71,33.49 U$1.21
N$14  (via drill 0.61)
  Top 0.254: v20.95,32.22 20.95,42.38 22.22,43.65 IC8.5
  Bottom 0.254: v20.95,32.22 5.71,32.22 U$1.22
N$15  (via drill 0.61)
  Top 0.254: v90.8,13.17 90.8,8.09 89.53,6.82 RN1.7 | v104.77,14.44 IC2.1
  Bottom 0.254: v90.8,13.17 92.07,14.44 v104.77,14.44 | SV2.9 120.01,19.52 104.77,19.52 IC2.1
N$16  (via drill 0.61)
  Top 0.254: v90.8,22.06 90.8,15.71 88.26,13.17 88.26,6.82 86.99,5.55 RN1.8
  Bottom 0.254: v90.8,22.06 99.69,22.06 102.23,19.52 IC2.2 102.23,16.98 103.5,15.71 122.55,15.71 SV2.11
N$17  (via drill 0.61)
  Top 0.254: v93.34,6.82 93.34,1.74 98.42,1.74 | 98.42,1.74 98.42,13.17 99.69,14.44 IC2.3 | SV2.13 122.55,23.33 122.55,9.36 114.93,1.74 98.42,1.74
  Bottom 0.254: v93.34,6.82 85.72,6.82 84.45,5.55 RN1.9
N$18  (via drill 0.61)
  Top 0.254: v83.18,18.25 83.18,6.82 81.91,5.55 RN1.10 | v99.69,32.22 98.42,30.95 98.42,22.06 97.15,20.79 IC2.4
  Bottom 0.254: v83.18,18.25 85.72,20.79 95.88,20.79 97.15,19.52 IC2.4 | SV2.15 128.9,27.14 128.9,33.49 107.31,33.49 106.04,32.22 v99.69,32.22
N$19  (via drill 0.61)
  Top 0.254: LED4.A 135.25,62.7 v135.25,77.94
  Bottom 0.254: v135.25,77.94 132.71,80.48 126.36,80.48 125.09,81.75 117.47,81.75 114.93,84.29 IC10.8
N$20  (via drill 0.61)
  Top 0.254: v24.76,75.4 28.57,75.4 28.57,83.02 | 28.57,83.02 29.84,84.29 IC12.2 | 28.57,83.02 23.49,83.02 22.22,84.29 IC12.5
  Bottom 0.254: v24.76,75.4 20.95,75.4 19.68,74.13 IC14.6
N$21  (via drill 0.61)
  Top 0.254: v95.88,30.95 94.61,32.22 IC4.12 | v126.36,32.22 v126.36,65.24
  Bottom 0.254: 98.42,30.95 99.69,29.68 RN3.3 | v95.88,30.95 98.42,30.95 | SV1.1 108.58,67.78 107.31,66.51 107.31,65.24 v126.36,65.24 | v126.36,32.22 107.31,32.22 106.04,30.95 98.42,30.95
N$22  (via drill 0.61)
  Top 0.254: RN3.4 IC4.13 v97.15,38.57 | v112.39,50 SV1.3 | v116.2,44.92 v116.2,47.46
  Bottom 0.254: v112.39,50 114.93,47.46 v116.2,47.46 | v116.2,44.92 107.31,44.92 106.04,43.65 106.04,39.84 102.23,39.84 100.96,38.57 v97.15,38.57
N$23  (via drill 0.61)
  Top 0.254: SV1.5 114.93,33.49 116.2,32.22 v116.2,24.6
  Bottom 0.254: IC4.14 99.69,33.49 98.42,32.22 94.61,32.22 RN3.5 94.61,27.14 97.15,24.6 v116.2,24.6
N$24  (via drill 0.61)
  Top 0.254: SV1.7 116.2,66.51 v116.2,50
  Bottom 0.254: 100.96,37.3 93.34,37.3 93.34,30.95 92.07,29.68 RN3.6 | 100.96,37.3 102.23,36.03 IC4.15 | v116.2,50 121.28,44.92 125.09,44.92 126.36,43.65 126.36,38.57 102.23,38.57 100.96,37.3
N$25  (via drill 0.61)
  Top 0.254: v10.79,39.84 v10.79,50
  Bottom 0.254: v10.79,39.84 13.33,39.84 14.6,38.57 IC8.9 | v10.79,50 9.52,51.27 5.71,51.27 U$1.14
N$26  (via drill 0.61)
  Top 0.254: v15.87,55.08 15.87,47.46 17.14,46.19 IC8.7
  Bottom 0.254: v15.87,55.08 5.71,55.08 U$1.13
N$27  (via drill 0.61)
  Top 0.254: v12.06,42.38 12.06,22.06 5.71,22.06 U$1.26 | v24.76,47.46 23.49,48.73 23.49,53.81 26.03,56.35 26.03,70.32 24.76,71.59 IC14.4
  Bottom 0.254: IC14.4 24.76,74.13 26.03,75.4 31.11,75.4 32.38,74.13 IC14.1 | v12.06,42.38 23.49,42.38 23.49,47.46 v24.76,47.46
N$28  (via drill 0.61)
  Top 0.254: v118.74,22.06 v118.74,41.11 118.74,44.92 120.01,46.19 SV1.9 | v107.31,41.11 104.77,41.11 IC4.1
  Bottom 0.254: v118.74,22.06 100.96,22.06 99.69,23.33 93.34,23.33 89.53,27.14 RN3.7 | v118.74,41.11 v107.31,41.11
N$29  (via drill 0.61)
  Top 0.254: v88.26,37.3 88.26,30.95 86.99,29.68 RN3.8 | SV1.11 121.28,69.05 118.74,69.05 v118.74,46.19 | v107.31,46.19 106.04,47.46 102.23,47.46 IC4.2
  Bottom 0.254: v88.26,37.3 90.8,39.84 100.96,39.84 102.23,41.11 IC4.2 | v107.31,46.19 v118.74,46.19
N$30  (via drill 0.61)
  Top 0.254: RN3.9 v84.45,44.92 | v125.09,43.65 SV1.13 | v107.31,42.38 106.04,43.65 v106.04,44.92
  Bottom 0.254: v84.45,44.92 85.72,46.19 97.15,46.19 98.42,44.92 | 98.42,44.92 99.69,43.65 IC4.3 | v125.09,43.65 123.82,42.38 v107.31,42.38 | 98.42,44.92 v106.04,44.92
N$31  (via drill 0.61)
  Top 0.254: v27.3,67.78 IC14.3
  Bottom 0.254: IC14.10 22.22,66.51 23.49,67.78 v27.3,67.78 28.57,67.78 29.84,66.51 IC14.13
N$32
  Bottom 0.254: R4.2 LED4.K
N$33  (via drill 0.61)
  Top 0.254: v92.07,30.95 93.34,32.22 93.34,37.3 97.15,41.11 IC4.4 | v130.17,79.21 v130.17,70.32 | v112.39,86.83 112.39,88.1 106.04,94.45 78.1,94.45 v78.1,70.32 | v81.91,66.51 83.18,65.24 83.18,30.95 81.91,29.68 RN3.10
  Bottom 0.254: v92.07,30.95 83.18,30.95 81.91,29.68 RN3.10 | v130.17,70.32 SV1.15 | v130.17,79.21 113.66,79.21 109.85,83.02 109.85,84.29 v112.39,86.83 | v81.91,66.51 v78.1,70.32
N$34  (via drill 0.61)
  Top 0.254: v42.54,77.94 42.54,91.91 24.76,91.91 20.95,88.1 20.95,70.32 19.68,69.05 IC14.9 | v84.45,8.09 v84.45,15.71 | IC10.1 IC10.2
  Bottom 0.254: v42.54,77.94 43.81,76.67 50.16,76.67 50.16,71.59 81.91,71.59 84.45,69.05 95.88,69.05 97.15,67.78 107.31,67.78 108.58,69.05 121.28,69.05 121.28,75.4 136.52,75.4 | 136.52,75.4 137.79,76.67 137.79,91.91 130.17,91.91 IC10.1 | v84.45,15.71 93.34,15.71 94.61,16.98 IC2.5 | v84.45,8.09 83.18,6.82 83.18,1.74 128.9,1.74 139.06,11.9 139.06,75.4 136.52,75.4
N$35  (via drill 0.61)
  Top 0.254: v38.73,66.51 38.73,58.89 40,57.62 40,3.01 53.97,3.01 56.51,5.55 IC1.20 | v29.84,67.78 28.57,67.78 v28.57,61.43
  Bottom 0.254: v38.73,66.51 34.92,66.51 33.65,67.78 v29.84,67.78 | v28.57,61.43 19.68,61.43 17.14,63.97 IC14.8
N$36
  Bottom 0.254: IC14.12 27.3,63.97 28.57,62.7 34.92,62.7 37.46,65.24 83.18,65.24 85.72,67.78 93.34,67.78 94.61,66.51 IC15.5
N$37  (via drill 0.61)
  Top 0.254: IC5.20 v56.51,85.56 57.78,86.83 57.78,91.91 v66.67,91.91 | v116.2,80.48 113.66,83.02 113.66,88.1 v109.85,91.91 | v125.09,80.48 IC10.12
  Bottom 0.254: IC10.12 IC10.13 | v56.51,85.56 36.19,85.56 33.65,88.1 20.95,88.1 19.68,86.83 IC12.6 | v116.2,80.48 v125.09,80.48 | v66.67,91.91 v109.85,91.91
N$38  (via drill 0.61)
  Top 0.254: IC13.13 RN4.4 v97.15,69.05
  Bottom 0.254: SV4.7 111.12,71.59 107.31,71.59 104.77,69.05 v97.15,69.05
N$39
  Top 0.254: IC13.14 99.69,79.21 100.96,77.94 100.96,71.59 97.15,67.78 94.61,67.78 RN4.5
  Bottom 0.254: SV4.6 111.12,76.67 95.88,76.67 94.61,75.4 RN4.5
N$40
  Top 0.254: RN4.6 92.07,75.4 93.34,76.67 93.34,83.02 94.61,84.29 102.23,84.29 IC13.15
  Bottom 0.254: SV4.5 112.39,77.94 103.5,77.94 102.23,79.21 IC13.15
N$41  (via drill 0.61)
  Top 0.254: v102.23,77.94 103.5,77.94 103.5,85.56 104.77,86.83 IC13.1 | SV4.4 112.39,80.48 109.85,80.48 v109.85,86.83
  Bottom 0.254: v102.23,77.94 92.07,77.94 89.53,75.4 RN4.7 | v109.85,86.83 104.77,86.83 IC13.1
N$42  (via drill 0.61)
  Top 0.254: v88.26,90.64 88.26,77.94 86.99,76.67 RN4.8 | SV4.3 113.66,81.75 111.12,81.75 v111.12,88.1
  Bottom 0.254: v88.26,90.64 100.96,90.64 | 100.96,90.64 102.23,89.37 IC13.2 | v111.12,88.1 108.58,90.64 100.96,90.64
N$43  (via drill 0.61)
  Top 0.254: RN4.9 84.45,89.37 86.99,91.91 95.88,91.91 95.88,85.56 99.69,85.56 IC13.3 | v94.61,60.16 93.34,61.43 v93.34,71.59
  Bottom 0.254: SV4.2 126.36,74.13 128.9,74.13 131.44,71.59 131.44,62.7 122.55,62.7 118.74,58.89 107.31,58.89 106.04,60.16 v94.61,60.16 | v93.34,71.59 85.72,71.59 84.45,72.86 RN4.9
N$44  (via drill 0.61)
  Top 0.254: IC10.10 IC10.9 v117.47,90.64 | v57.78,70.32 57.78,56.35 56.51,55.08 IC3.20 | v40,69.05 v40,80.48
  Bottom 0.254: v57.78,70.32 42.54,70.32 41.27,69.05 v40,69.05 23.49,69.05 22.22,67.78 20.95,67.78 20.95,62.7 23.49,62.7 24.76,63.97 IC14.11 | v117.47,90.64 112.39,90.64 109.85,93.18 66.67,93.18 65.4,91.91 65.4,83.02 69.21,83.02 70.48,81.75 70.48,80.48 v40,80.48
N$45
  Top 0.254: IC13.12 94.61,81.75 95.88,83.02 98.42,83.02 98.42,76.67 99.69,75.4 RN4.3
  Bottom 0.254: SV4.8 107.31,72.86 106.04,71.59 100.96,71.59 99.69,72.86 RN4.3
N$46  (via drill 0.61)
  Top 0.254: v83.18,85.56 83.18,76.67 81.91,75.4 RN4.10 | v108.58,66.51 107.31,67.78 107.31,83.02 106.04,84.29 106.04,90.64 97.15,90.64 IC13.4
  Bottom 0.254: v83.18,85.56 95.88,85.56 97.15,86.83 IC13.4 | SV4.1 126.36,71.59 126.36,66.51 v108.58,66.51
N$47  (via drill 0.61)
  Top 0.254: v41.27,28.41 v41.27,86.83 | v34.92,88.1 27.3,88.1 IC12.3
  Bottom 0.254: v41.27,28.41 55.24,28.41 56.51,29.68 IC11.20 | v41.27,86.83 40,88.1 v34.92,88.1
N$49  (via drill 0.61)
  Top 0.254: v40,83.02 40,90.64 28.57,90.64 24.76,86.83 IC12.4 | v69.21,81.75 70.48,80.48 v70.48,79.21 | v90.8,77.94 90.8,83.02 94.61,86.83 IC13.5
  Bottom 0.254: v40,83.02 41.27,81.75 v69.21,81.75 | v70.48,79.21 71.75,77.94 v90.8,77.94
N$50  (via drill 0.61)
  Top 0.254: v12.06,18.25 6.98,13.17 6.98,9.36 3.17,9.36 3.17,90.64 4.44,91.91 8.25,91.91 v8.25,72.86 | v20.95,69.05 22.22,70.32 IC14.5
  Bottom 0.254: v12.06,18.25 18.41,18.25 18.41,23.33 28.57,23.33 29.84,22.06 IC9.15 | v8.25,72.86 12.06,69.05 v20.95,69.05
N$51  (via drill 0.61)
  Top 0.254: IC10.5 IC10.4 122.55,91.91 123.82,90.64 v123.82,61.43 | v34.92,81.75 32.38,84.29 IC12.1 | v38.73,81.75 38.73,67.78 40,66.51 v40,60.16 | v107.31,57.62 106.04,58.89 106.04,60.16 103.5,62.7 v103.5,70.32 | v84.45,58.89 v84.45,70.32
  Bottom 0.254: v38.73,81.75 v34.92,81.75 | v40,60.16 43.81,56.35 71.75,56.35 73.02,55.08 | 73.02,55.08 73.02,43.65 84.45,43.65 85.72,44.92 93.34,44.92 94.61,43.65 IC4.5 | v123.82,61.43 120.01,57.62 v107.31,57.62 | v84.45,70.32 v103.5,70.32 | v84.45,58.89 80.64,55.08 73.02,55.08
N$55  (via drill 0.61)
  Top 0.254: v98.42,53.81 98.42,52.54 99.69,51.27 RN2.3 | SV3.8 111.12,32.22 v111.12,53.81
  Bottom 0.254: IC15.12 94.61,56.35 93.34,56.35 93.34,55.08 94.61,53.81 v98.42,53.81 v111.12,53.81
N$56
  Top 0.254: LED5.K 131.44,77.94 135.25,81.75 R5.1
N$57
  Bottom 0.254: LED5.A 136.52,76.67 136.52,77.94 131.44,83.02 123.82,83.02 122.55,84.29 IC10.11
N$58
  Top 0.254: LED2.A 139.06,30.95 139.06,88.1 135.25,91.91 131.44,91.91 131.44,90.64 125.09,90.64 IC10.3
N$59
  Top 0.254: R2.2 131.44,24.6 LED2.K
N$60  (via drill 0.61)
  Top 0.254: RN2.4 IC15.13 | SV3.7 v112.39,47.46
  Bottom 0.254: v112.39,47.46 98.42,47.46 97.15,48.73 RN2.4
N$61
  Bottom 0.254: LED3.K 136.52,38.57 R3.1
N$62  (via drill 0.61)
  Top 0.254: LED3.A 132.71,44.92 v132.71,77.94 | v121.28,77.94 116.2,83.02 116.2,90.64 117.47,91.91 IC10.6
  Bottom 0.254: v132.71,77.94 v121.28,77.94
N$63  (via drill 0.61)
  Top 0.254: v99.69,52.54 IC15.14 | SV3.6 113.66,32.22 v113.66,52.54
  Bottom 0.254: RN2.5 94.61,51.27 95.88,52.54 v99.69,52.54 v113.66,52.54
N$64  (via drill 0.61)
  Top 0.254: v94.61,55.08 94.61,53.81 92.07,51.27 RN2.6 | v117.47,52.54 SV3.5
  Bottom 0.254: v94.61,55.08 100.96,55.08 | 100.96,55.08 102.23,56.35 IC15.15 | v117.47,52.54 114.93,55.08 100.96,55.08
N$65  (via drill 0.61)
  Top 0.254: v90.8,60.16 90.8,53.81 89.53,52.54 RN2.7 | v106.04,61.43 104.77,62.7 IC15.1 | SV3.4 121.28,29.68 123.82,29.68 123.82,42.38 122.55,43.65 v122.55,63.97
  Bottom 0.254: v90.8,60.16 92.07,61.43 v106.04,61.43 120.01,61.43 v122.55,63.97
N$66  (via drill 0.61)
  Top 0.254: v88.26,60.16 88.26,55.08 86.99,53.81 RN2.8 | SV3.3 121.28,32.22 v121.28,63.97
  Bottom 0.254: v88.26,60.16 90.8,62.7 100.96,62.7 | 100.96,62.7 102.23,63.97 IC15.2 | v121.28,63.97 107.31,63.97 106.04,62.7 100.96,62.7
N$67  (via drill 0.61)
  Top 0.254: v97.15,47.46 100.96,47.46 | 100.96,47.46 100.96,62.7 99.69,63.97 IC15.3 | SV3.2 125.09,42.38 v123.82,43.65 | v107.31,43.65 107.31,44.92 106.04,46.19 103.5,46.19 103.5,39.84 100.96,39.84 100.96,47.46
  Bottom 0.254: v97.15,47.46 85.72,47.46 84.45,48.73 RN2.9 | v107.31,43.65 v123.82,43.65
N$68  (via drill 0.61)
  Top 0.254: v94.61,52.54 95.88,53.81 | 95.88,53.81 95.88,62.7 97.15,63.97 IC15.4 | v102.23,37.3 98.42,37.3 98.42,44.92 95.88,47.46 95.88,53.81
  Bottom 0.254: v94.61,52.54 83.18,52.54 81.91,51.27 RN2.10 | SV3.1 126.36,29.68 126.36,24.6 128.9,24.6 130.17,25.87 130.17,36.03 107.31,36.03 106.04,37.3 v102.23,37.3
RD  (via drill 0.61)
  Top 0.254: IC1.22 61.59,8.09 62.86,9.36 62.86,25.87 61.59,27.14 IC11.22 61.59,42.38 62.86,43.65 62.86,48.73 61.59,50 IC3.22 61.59,55.08 62.86,56.35 62.86,70.32 61.59,71.59 IC5.22 | v18.41,55.08 18.41,47.46 19.68,46.19 IC8.6
  Bottom 0.254: v18.41,55.08 32.38,55.08 37.46,50 60.32,50 61.59,51.27 IC3.22
VCC  (via drill 0.61)
  Top 0.254: IC6.16 32.38,8.09 33.65,9.36 33.65,10.63 C2.1 34.92,16.98 | 34.92,16.98 32.38,19.52 IC9.16 | 34.92,16.98 34.92,24.6 C1.1 37.46,27.14 37.46,43.65 | IC9.6 19.68,27.14 18.41,25.87 18.41,16.98 19.68,15.71 IC6.6 | v10.79,86.83 12.06,88.1 C8.+ | IC7.1 IC14.14 | 37.46,71.59 C15.1 | 37.46,71.59 v37.46,77.94 37.46,81.75 C16.1 36.19,88.1 v34.92,89.37 | 37.46,43.65 C13.1 | 37.46,56.35 37.46,71.59 | 37.46,43.65 37.46,56.35 | 37.46,56.35 C14.1 | IC1.28 76.83,8.09 79.37,10.63 79.37,15.71 C9.1 79.37,18.25 79.37,41.11 | 79.37,41.11 79.37,48.73 76.83,51.27 IC3.28 76.83,53.81 75.56,55.08 75.56,62.7 | 79.37,41.11 C10.1 | 75.56,62.7 75.56,71.59 76.83,72.86 IC5.28 | RN1.1 IC2.16 104.77,11.9 103.5,13.17 103.5,25.87 104.77,27.14 RN3.1 IC4.16 104.77,36.03 C6.1 108.58,48.73 104.77,48.73 RN2.1 104.77,56.35 | C3.1 130.17,86.83 IC10.14 | IC13.16 RN4.1 104.77,72.86 106.04,71.59 106.04,65.24 107.31,63.97 | 107.31,63.97 C5.1 | 104.77,56.35 108.58,56.35 108.58,57.62 107.31,58.89 107.31,63.97 | 104.77,56.35 IC15.16 | 75.56,62.7 79.37,62.7 79.37,83.02 C12.1
  Bottom 0.254: IC6.6 19.68,13.17 20.95,11.9 C2.1 36.19,13.17 76.83,13.17 C9.1 | v10.79,86.83 6.98,86.83 5.71,85.56 U$1.1 | C14.1 34.92,57.62 32.38,57.62 IC7.1 | C13.1 33.65,42.38 32.38,43.65 IC8.1 | v37.46,77.94 IC12.14 | C8.+ 13.33,89.37 v34.92,89.37 | C10.1 76.83,39.84 IC11.28 | C11.1 84.45,60.16 85.72,58.89 85.72,57.62 84.45,57.62 80.64,53.81 76.83,53.81 IC3.28 | IC2.16 104.77,11.9 107.31,11.9 C7.1 130.17,13.17 LED1.A | C12.1 102.23,84.29 104.77,81.75 | 104.77,81.75 C4.1 109.85,85.56 112.39,88.1 128.9,88.1 130.17,86.83 IC10.14 | 104.77,81.75 IC13.16
WR  (via drill 0.61)
  Top 0.254: IC1.27 74.29,8.09 75.56,9.36 75.56,28.41 74.29,29.68 IC11.27 | v23.49,9.36 23.49,30.95 20.95,30.95 19.68,32.22 19.68,33.49 17.14,36.03 IC8.10
  Bottom 0.254: v23.49,9.36 33.65,9.36 33.65,8.09 41.27,8.09 42.54,9.36 73.02,9.36 74.29,8.09 IC1.27

### Text on the board
tNames: EPROM HI | HI 32K | EPROM LO | RAM HI | LO 32K | RAM LO | BANK 7 | BANK 6 | BANK 5 | BANK 4 | BANK 3 | BANK 2 | BANK 1 | BANK 0 | PWR